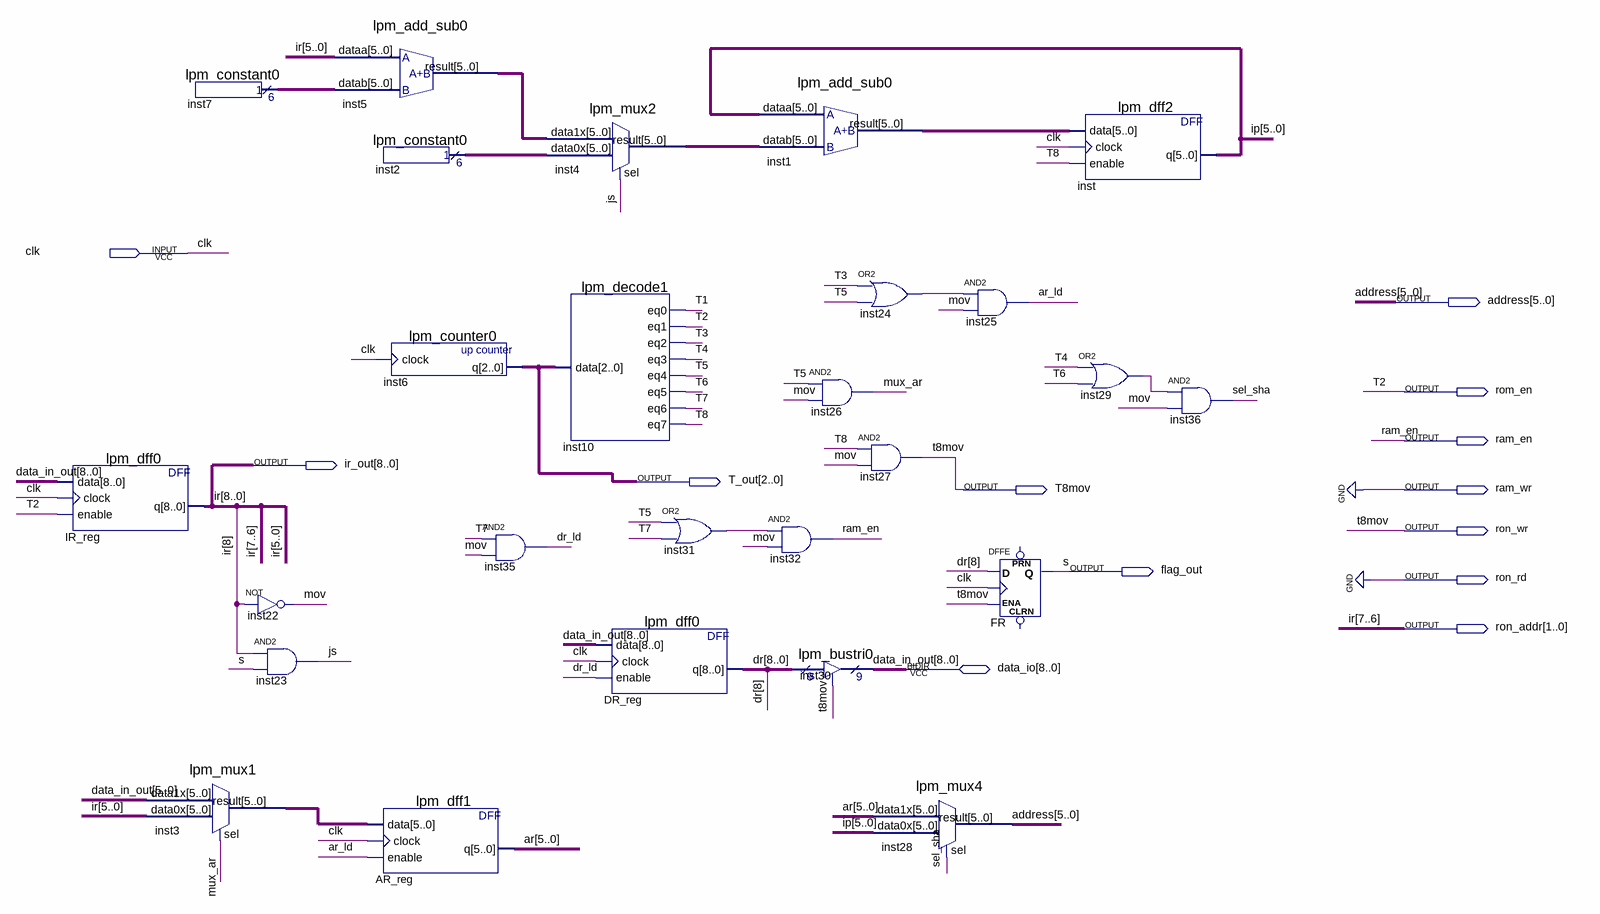
[diagram p0: schematic sheet]
// Quartus schematic uu.bdf as structural Verilog: 26 symbols, 13 pins
module uu (
  input  clk,
  inout  [8:0] data_io,
  output [5:0] address,
  output rom_en,
  output ram_en,
  output [8:0] ir_out,
  output [2:0] T_out,
  output T8mov,
  output ram_wr,
  output ron_wr,
  output flag_out,
  output ron_rd,
  output [1:0] ron_addr
);

  wire ar_ld, dr_ld, inst24_out, inst29_out, inst31_out, js, mov, mux_ar, sel_sha, T1, T3, T4, T5, T6, T7, T8;
  wire [5:0] ar, inst1_result, inst2_result, inst3_result, inst4_result, inst5_result, inst7_result, ip;
  wire [8:0] dr;

  lpm_dff0 IR_reg (.data(data_io), .clock(clk), .enable(rom_en), .q(ir_out));
  lpm_mux1 inst3 (.data1x(data_io[5:0]), .data0x(ir_out[5:0]), .sel(mux_ar), .result(inst3_result));
  lpm_constant0 inst7 (.result(inst7_result));
  not inst22 (mov, ir_out[8]);
  and inst23 (js, ir_out[8], flag_out);
  lpm_add_sub0 inst5 (.dataa(ir_out[5:0]), .datab(inst7_result), .result(inst5_result));
  lpm_constant0 inst2 (.result(inst2_result));
  lpm_counter0 inst6 (.clock(clk), .q(T_out));
  lpm_dff1 AR_reg (.data(inst3_result), .clock(clk), .enable(ar_ld), .q(ar));
  and inst35 (dr_ld, T7, mov);
  lpm_mux2 inst4 (.data1x(inst5_result), .data0x(inst2_result), .sel(js), .result(inst4_result));
  lpm_decode1 inst10 (.data(T_out), .eq0(T1), .eq1(rom_en), .eq2(T3), .eq3(T4), .eq4(T5), .eq5(T6), .eq6(T7), .eq7(T8));
  lpm_dff0 DR_reg (.data(data_io), .clock(clk), .enable(dr_ld), .q(dr));
  or inst31 (inst31_out, T5, T7);
  lpm_add_sub0 inst1 (.dataa(ip), .datab(inst4_result), .result(inst1_result));
  and inst26 (mux_ar, T5, mov);
  and inst32 (ram_en, inst31_out, mov);
  lpm_bustri0 inst30 (.enabledt(ron_wr), .data(dr), .tridata(data_io));
  or inst24 (inst24_out, T3, T5);
  and inst27 (ron_wr, T8, mov);
  lpm_mux4 inst28 (.data1x(ar), .data0x(ip), .sel(sel_sha), .result(address));
  and inst25 (ar_ld, inst24_out, mov);
  DFFE FR (.D(dr[8]), .CLK(clk), .ENA(ron_wr), .Q(flag_out));  // open: PRN, CLRN
  lpm_dff2 inst (.data(inst1_result), .clock(clk), .enable(T8), .q(ip));
  or inst29 (inst29_out, T4, T6);
  and inst36 (sel_sha, inst29_out, mov);

  assign ram_wr = 1'b0;
  assign ron_addr = ir_out[7:6];
  assign ron_rd = 1'b0;
  assign T8mov = ron_wr;

  // Other names for the same wires on the sheet: data_in_out[8:0] = data_io; ir[8:0] = ir_out; s = flag_out;
  //   T2 = rom_en
endmodule
